# Altium schematic sheet Sheet1_Diagrama.SchDoc
size A4; SheetNumber: 2; SheetTotal: 6
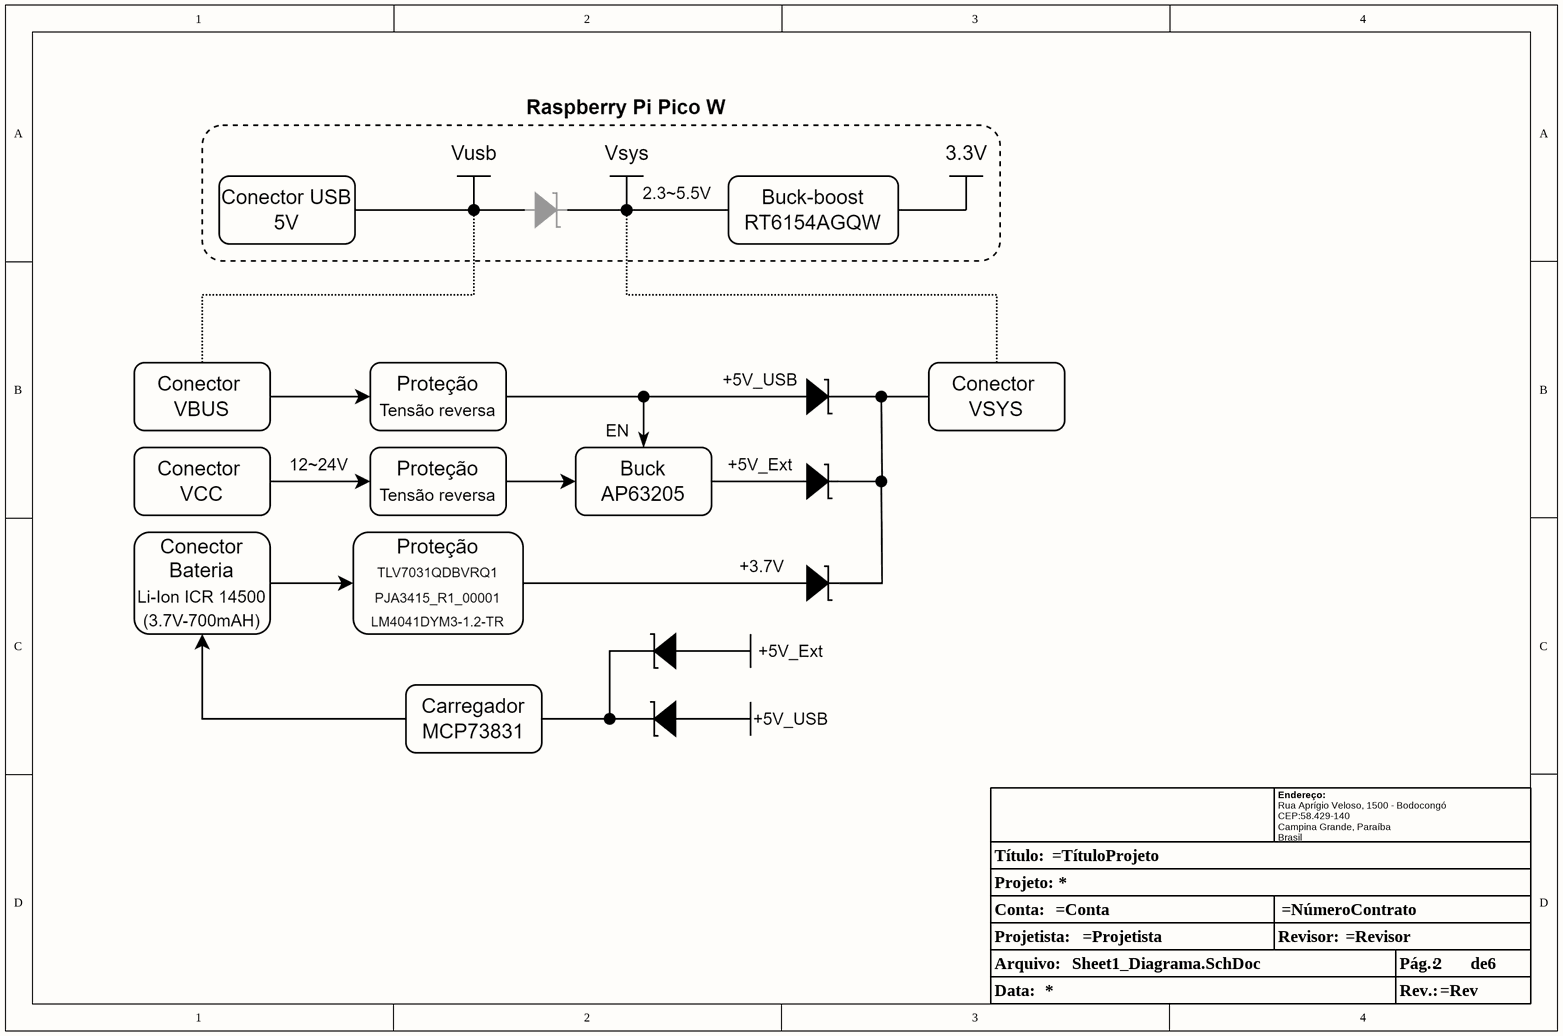
[diagram p0: Sheet1_Diagrama.SchDoc]

## Parts
TB?  Title Block  (value not drawn)  (graphical)

## Notes on the sheet
- (in symbol Title Block) Endereço: /; Rua Aprígio Veloso, 1500 - Bodocongó / CEP:58.429-140 / Campina Grande, Paraíba / Brasil; Título:; Projeto:; Conta:; Projetista:; Revisor:; Arquivo:; Pág.:; de; Data:; Rev.: